# Altium schematic sheet MainController2.SchDoc
size A4; SheetNumber: 3; SheetTotal: 5
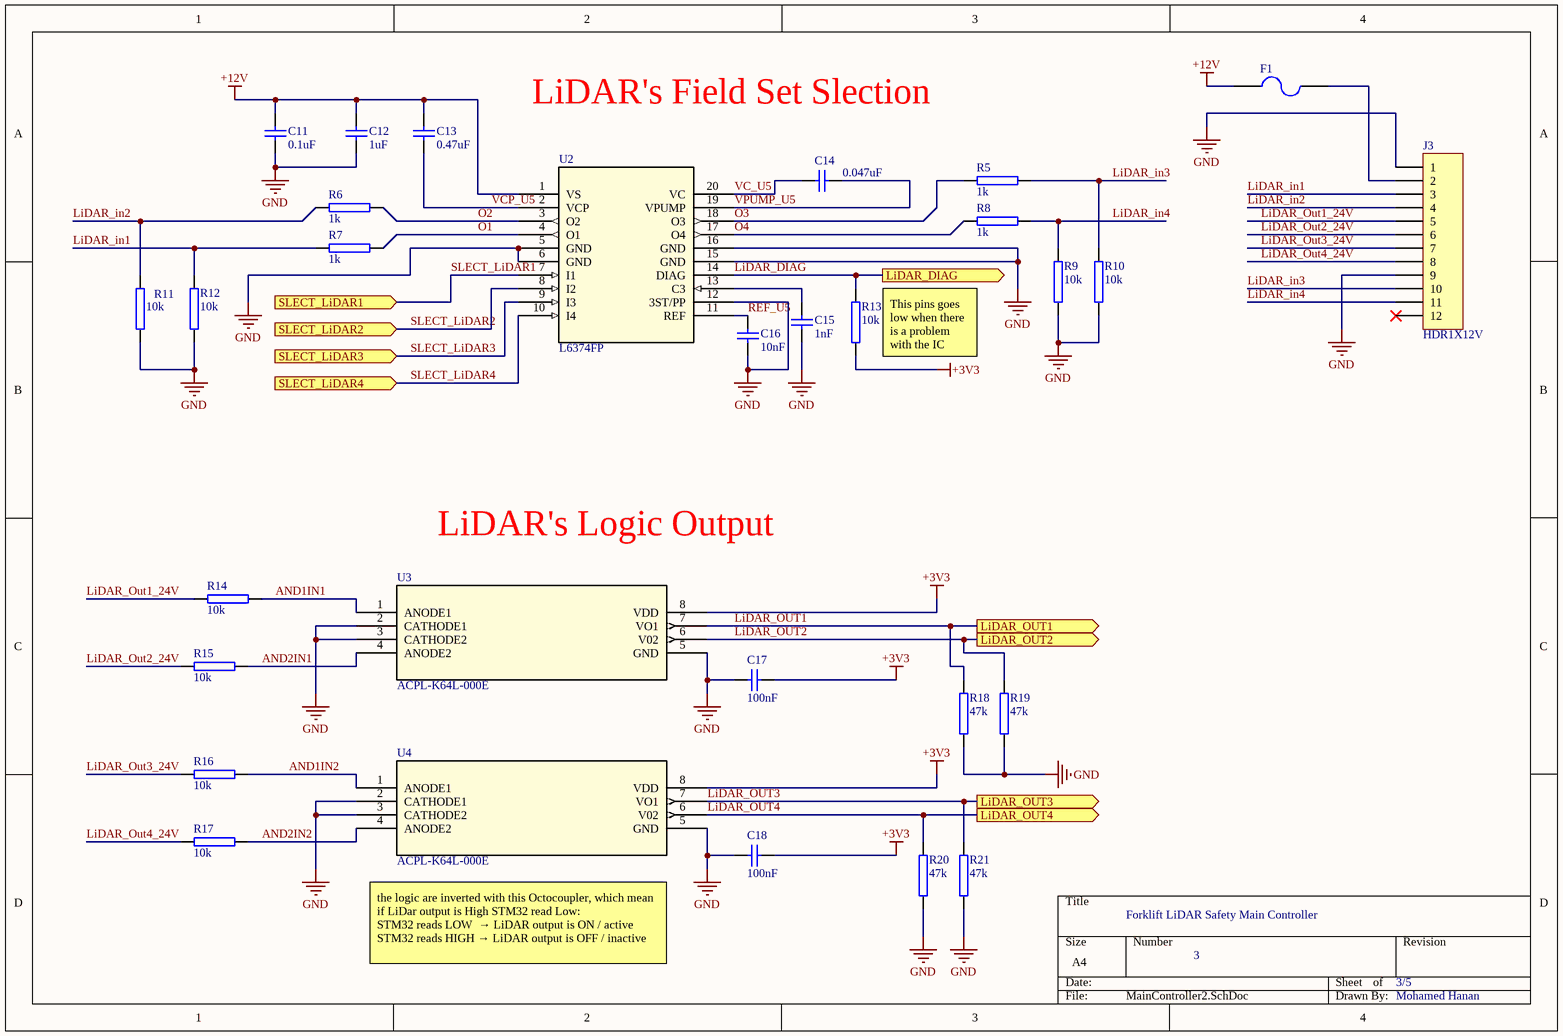
[diagram p0: MainController2.SchDoc]

## Parts
C11  0.1uF  [CAP_0805]
C12  1uF  [CAP_0805]
C13  0.47uF  [CAP_0805]
C14  0.047uF  [CAP_1206]
C15  1nF  [CAP_0805]
C16  10nF  [CAP_0805]
C17  100nF  [CAP_0805]
C18  100nF  [CAP_0805]
F1  1206L035/16YR  [MC36207]  (value not drawn)
J3  HDR1X12V  [HDR1X12_AUT]
R5  1k  [RES_1206]
R6  1k  [RES_1206]
R7  1k  [RES_1206]
R8  1k  [RES_1206]
R9  10k  [RES_0805]
R10  10k  [RES_0805]
R11  10k  [RES_0805]
R12  10k  [RES_0805]
R13  10k  [RES_0805]
R14  10k  [RES_0805]
R15  10k  [RES_0805]
R16  10k  [RES_0805]
R17  10k  [RES_0805]
R18  47k  [RES_0805]
R19  47k  [RES_0805]
R20  47k  [RES_0805]
R21  47k  [RES_0805]
U2  L6374FP  [20S_M]
U3  ACPL-K64L-000E  [STRETCHED_SO-8_AVA]
U4  ACPL-K64L-000E  [STRETCHED_SO-8_AVA]

## Ports
LiDAR_DIAG (out, see ConnectionMain[2A], MainController[4A]), LiDAR_OUT1 (out, see ConnectionMain[2B], MainController[3B]), LiDAR_OUT2 (out, see ConnectionMain[2B], MainController[3B]), LiDAR_OUT3 (out, see ConnectionMain[2B], MainController[2C]), LiDAR_OUT4 (out, see ConnectionMain[2B], MainController[3B]), SLECT_LiDAR1 (in, see ConnectionMain[2A], MainController[3A]), SLECT_LiDAR2 (in, see ConnectionMain[2A], MainController[3A]), SLECT_LiDAR3 (in, see ConnectionMain[2A], MainController[3B]), SLECT_LiDAR4 (in, see ConnectionMain[2A], MainController[2B])

## Nets
+3V3: C17.2 C18.2 R13.1 U3.8(VDD) U4.8(VDD)
+12V: C11.2 C12.2 C13.2 F1.1 U2.1(VS)
GND: C11.1 C12.1 C15.1 C16.1 C17.1 C18.1 J3.1 J3.9 R9.1 R10.1 R11.1 R12.1 R18.1 R19.1 R20.1 R21.1 U2.5(GND) U2.6(GND) U2.12(3ST/PP) U2.15(GND) U2.16(GND) U3.2(CATHODE1) U3.3(CATHODE2) U3.5(GND) U4.2(CATHODE1) U4.3(CATHODE2) U4.5(GND)
AND1IN1: R14.2 U3.1(ANODE1)
AND1IN2: R16.2 U4.1(ANODE1)
AND2IN1: R15.2 U3.4(ANODE2)
AND2IN2: R17.2 U4.4(ANODE2)
LiDAR_DIAG: R13.2 U2.14(DIAG) ; port LiDAR_DIAG
LiDAR_in1: J3.3 R7.1 R12.2
LiDAR_in2: J3.4 R6.1 R11.2
LiDAR_in3: J3.10 R5.2 R10.2
LiDAR_in4: J3.11 R8.2 R9.2
LiDAR_OUT1: R18.2 U3.7(VO1) ; port LiDAR_OUT1
LiDAR_Out1_24V: J3.5 R14.1
LiDAR_OUT2: R19.2 U3.6(V02) ; port LiDAR_OUT2
LiDAR_Out2_24V: J3.6 R15.1
LiDAR_OUT3: R21.2 U4.7(VO1) ; port LiDAR_OUT3
LiDAR_Out3_24V: J3.7 R16.1
LiDAR_OUT4: R20.2 U4.6(V02) ; port LiDAR_OUT4
LiDAR_Out4_24V: J3.8 R17.1
O1: R7.2 U2.4(O1)
O2: R6.2 U2.3(O2)
O3: R5.1 U2.18(O3)
O4: R8.1 U2.17(O4)
REF_U5: C16.2 U2.11(REF)
SLECT_LiDAR1: U2.7(I1) ; port SLECT_LiDAR1
SLECT_LiDAR2: U2.8(I2) ; port SLECT_LiDAR2
SLECT_LiDAR3: U2.9(I3) ; port SLECT_LiDAR3
SLECT_LiDAR4: U2.10(I4) ; port SLECT_LiDAR4
VC_U5: C14.1 U2.20(VC)
VCP_U5: C13.1 U2.2(VCP)
VPUMP_U5: C14.2 U2.19(VPUMP)
NetC15_2: C15.2 U2.13(C3)
NetF1_2: F1.2 J3.2

Not connected (* = marked no-connect by the designer): J3 12*

## Notes on the sheet
- LiDAR's Field Set Slection
- (near R13) This pins goes low when there is a problem with the IC
- LiDAR's Logic Output
- Forklift LiDAR Safety Main Controller
- the logic are inverted with this Octocoupler, which mean if LiDar output is High STM32 read Low:
  STM32 reads LOW  → LiDAR output is ON / active
  STM32 reads HIGH → LiDAR output is OFF / inactive
- 3
- 3/5
- Mohamed Hanan

## Library data of the parts
C11-C13 C15-C18 = CAPN 0805: Non Polarized Capacitor, SMD, 0805
C14 = CAPN 1206: Non Polarized Capacitor, SMD, 1206
F1 = 1206L035/16YR: Fuse, PTC Reset, 350mA Hold, 750mA Tripping, 16v; Supplier 1: Element14; Supplier Part Number 1: 1822203
J3 = HDR1X12V: Header, Plug, 2.54mm, 12 Pins, Straight; Supplier 1: Farnell; Supplier Part Number 1: 9732543
R5-R8 = Resistor 1206: Resistor, SMD, 1206
R9-R21 = Resistor 0805: Resistor, SMD, 0805
U2 = L6374FP: INDUSTRIAL QUAD LINE DRIVER; Manufacturer_Name: STMicroelectronics; Copyright: Copyright (C) 2025 Ultra Librarian. All rights reserved.; Manufacturer_Part_Number: L6374FP; RefDes: RefDes; Type: Type
U3 U4 = ACPL-K64L-000E: Description; Manufacturer_Name: Avago Technologies; Copyright: Copyright (C) 2026 Ultra Librarian. All rights reserved.; Manufacturer_Part_Number: ACPL-K64L-000E; RefDes: RefDes; Type: Type